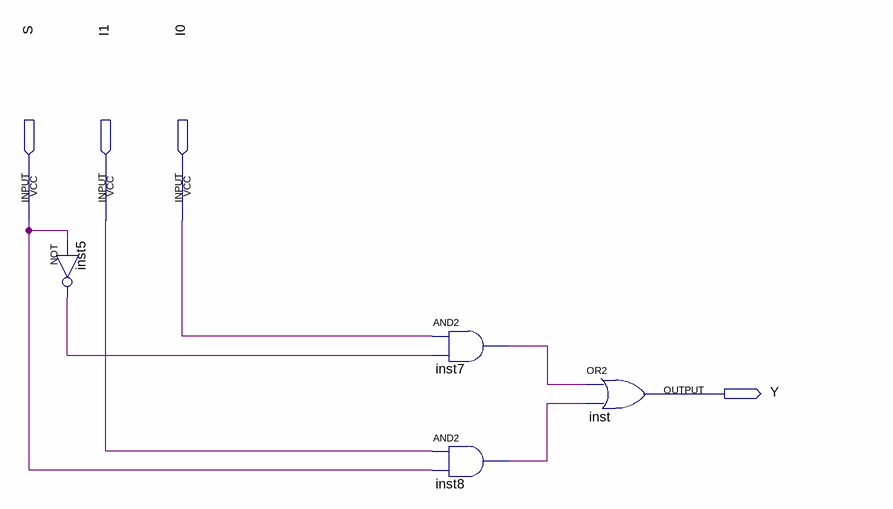
[diagram p0: schematic sheet]
// Quartus schematic Mux2_1.bdf as structural Verilog: 4 symbols, 4 pins
module Mux2_1 (
  input  S,
  input  I1,
  input  I0,
  output Y
);

  wire inst5_out, inst7_out, inst8_out;

  not inst5 (inst5_out, S);
  and inst7 (inst7_out, I0, inst5_out);
  and inst8 (inst8_out, I1, S);
  or inst (Y, inst7_out, inst8_out);
endmodule
